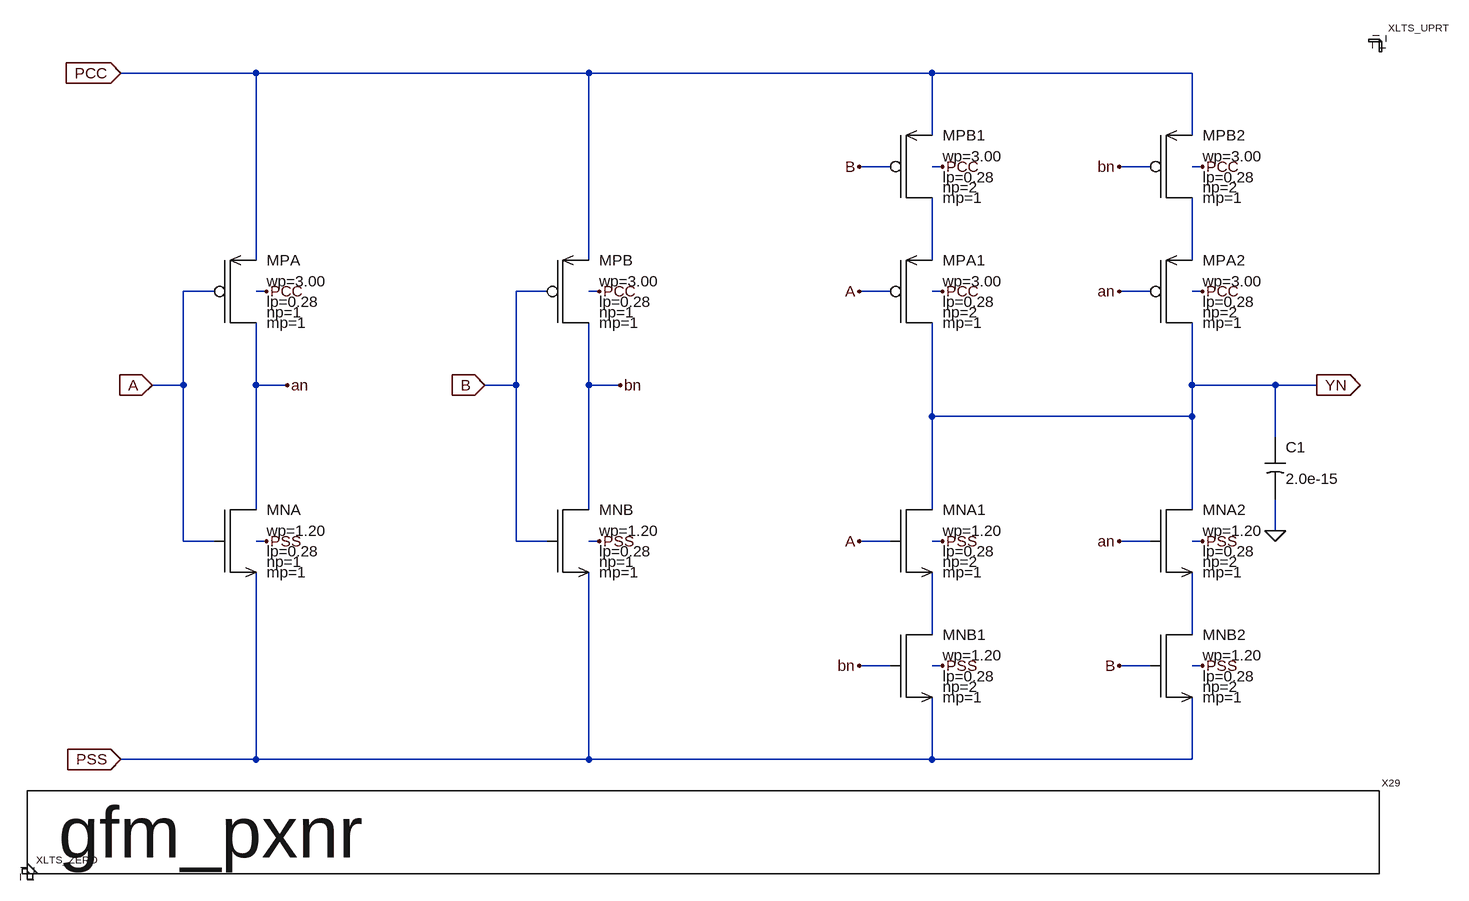
[diagram p0: schematic gfm_pxnr.asc]
gfm_pxnr.asc, the LTspice schematic file:
Version 4
SHEET 1 4552 4336
WIRE 352 -1232 144 -1232
WIRE 864 -1232 352 -1232
WIRE 1392 -1232 864 -1232
WIRE 1792 -1232 1392 -1232
WIRE 1392 -1136 1392 -1232
WIRE 1792 -1136 1792 -1232
WIRE 1328 -1088 1280 -1088
WIRE 1408 -1088 1392 -1088
WIRE 1728 -1088 1680 -1088
WIRE 1808 -1088 1792 -1088
WIRE 352 -944 352 -1232
WIRE 864 -944 864 -1232
WIRE 1392 -944 1392 -1040
WIRE 1792 -944 1792 -1040
WIRE 288 -896 240 -896
WIRE 368 -896 352 -896
WIRE 800 -896 752 -896
WIRE 880 -896 864 -896
WIRE 1328 -896 1280 -896
WIRE 1408 -896 1392 -896
WIRE 1728 -896 1680 -896
WIRE 1808 -896 1792 -896
WIRE 240 -752 240 -896
WIRE 240 -752 192 -752
WIRE 352 -752 352 -848
WIRE 400 -752 352 -752
WIRE 752 -752 752 -896
WIRE 752 -752 704 -752
WIRE 864 -752 864 -848
WIRE 912 -752 864 -752
WIRE 1792 -752 1792 -848
WIRE 1920 -752 1792 -752
WIRE 1984 -752 1920 -752
WIRE 1392 -704 1392 -848
WIRE 1792 -704 1792 -752
WIRE 1792 -704 1392 -704
WIRE 1920 -672 1920 -752
WIRE 352 -560 352 -752
WIRE 864 -560 864 -752
WIRE 1392 -560 1392 -704
WIRE 1792 -560 1792 -704
WIRE 1920 -528 1920 -576
WIRE 240 -512 240 -752
WIRE 288 -512 240 -512
WIRE 368 -512 352 -512
WIRE 752 -512 752 -752
WIRE 800 -512 752 -512
WIRE 880 -512 864 -512
WIRE 1328 -512 1280 -512
WIRE 1408 -512 1392 -512
WIRE 1728 -512 1680 -512
WIRE 1808 -512 1792 -512
WIRE 1392 -368 1392 -464
WIRE 1792 -368 1792 -464
WIRE 1328 -320 1280 -320
WIRE 1408 -320 1392 -320
WIRE 1728 -320 1680 -320
WIRE 1808 -320 1792 -320
WIRE 352 -176 352 -464
WIRE 352 -176 144 -176
WIRE 864 -176 864 -464
WIRE 864 -176 352 -176
WIRE 1392 -176 1392 -272
WIRE 1392 -176 864 -176
WIRE 1792 -176 1792 -272
WIRE 1792 -176 1392 -176
FLAG 144 -176 PSS
IOPIN 144 -176 In
FLAG 144 -1232 PCC
IOPIN 144 -1232 In
FLAG 192 -752 A
IOPIN 192 -752 In
FLAG 1984 -752 YN
IOPIN 1984 -752 Out
FLAG 1920 -528 0
FLAG 1808 -512 PSS
FLAG 1280 -512 A
FLAG 1408 -512 PSS
FLAG 1680 -512 an
FLAG 1808 -896 PCC
FLAG 1280 -896 A
FLAG 1408 -896 PCC
FLAG 1680 -896 an
FLAG 1808 -1088 PCC
FLAG 1408 -1088 PCC
FLAG 1808 -320 PSS
FLAG 1408 -320 PSS
FLAG 368 -512 PSS
FLAG 368 -896 PCC
FLAG 880 -512 PSS
FLAG 880 -896 PCC
FLAG 400 -752 an
FLAG 704 -752 B
IOPIN 704 -752 In
FLAG 912 -752 bn
FLAG 1280 -1088 B
FLAG 1280 -320 bn
FLAG 1680 -320 B
FLAG 1680 -1088 bn
SYMBOL gfmcu_nmos3p3 1328 -512 R0
SYMATTR InstName MNA1
SYMATTR SpiceLine np=2
SYMATTR Value wp=1.20
SYMATTR Value2 lp=0.28
SYMBOL gfmcu_nmos3p3 1328 -320 R0
SYMATTR InstName MNB1
SYMATTR SpiceLine np=2
SYMATTR Value wp=1.20
SYMATTR Value2 lp=0.28
SYMBOL gcap 1920 -672 R0
SYMATTR InstName C1
SYMATTR Value 2.0e-15
SYMBOL gfmcu_pmos3p3 1728 -896 R0
SYMATTR InstName MPA2
SYMATTR SpiceLine np=2
SYMATTR Value wp=3.00
SYMATTR Value2 lp=0.28
SYMBOL gfmcu_pmos3p3 1728 -1088 R0
SYMATTR InstName MPB2
SYMATTR SpiceLine np=2
SYMATTR Value wp=3.00
SYMATTR Value2 lp=0.28
SYMBOL gfmcu_pmos3p3 1328 -896 R0
SYMATTR InstName MPA1
SYMATTR SpiceLine np=2
SYMATTR Value wp=3.00
SYMATTR Value2 lp=0.28
SYMBOL gfmcu_pmos3p3 1328 -1088 R0
SYMATTR InstName MPB1
SYMATTR SpiceLine np=2
SYMATTR Value wp=3.00
SYMATTR Value2 lp=0.28
SYMBOL BD_GTitleLTS 0 0 R0
SYMATTR InstName X29
SYMATTR SpiceModel gfm_pxnr
SYMBOL gfmcu_nmos3p3 1728 -512 R0
SYMATTR InstName MNA2
SYMATTR SpiceLine np=2
SYMATTR Value wp=1.20
SYMATTR Value2 lp=0.28
SYMBOL gfmcu_nmos3p3 1728 -320 R0
SYMATTR InstName MNB2
SYMATTR SpiceLine np=2
SYMATTR Value wp=1.20
SYMATTR Value2 lp=0.28
SYMBOL gfmcu_nmos3p3 288 -512 R0
SYMATTR InstName MNA
SYMATTR Value wp=1.20
SYMATTR Value2 lp=0.28
SYMBOL gfmcu_pmos3p3 288 -896 R0
SYMATTR InstName MPA
SYMATTR Value wp=3.00
SYMATTR Value2 lp=0.28
SYMBOL gfmcu_nmos3p3 800 -512 R0
SYMATTR InstName MNB
SYMATTR Value wp=1.20
SYMATTR Value2 lp=0.28
SYMBOL gfmcu_pmos3p3 800 -896 R0
SYMATTR InstName MPB
SYMATTR Value wp=3.00
SYMATTR Value2 lp=0.28
SYMBOL BD_ZERO 0 0 R0
SYMATTR InstName XLTS_ZERO
SYMBOL BD_UPRT 2080 -1280 R0
SYMATTR InstName XLTS_UPRT

The netlist it stands for:
* gfm_pxnr.asc
XMNA1 YN A N003 PSS gfmcu_nmos3p3 wp=1.20 lp=0.28 np=2 mp=1  ; pins ND NG NS NB
XMNB1 N003 bn PSS PSS gfmcu_nmos3p3 wp=1.20 lp=0.28 np=2 mp=1  ; pins ND NG NS NB
C1 YN 0 2.0e-15
XMPA2 YN an N002 PCC gfmcu_pmos3p3 wp=3.00 lp=0.28 np=2 mp=1  ; pins ND NG NS NB
XMPB2 N002 bn PCC PCC gfmcu_pmos3p3 wp=3.00 lp=0.28 np=2 mp=1  ; pins ND NG NS NB
XMPA1 YN A N001 PCC gfmcu_pmos3p3 wp=3.00 lp=0.28 np=2 mp=1  ; pins ND NG NS NB
XMPB1 N001 B PCC PCC gfmcu_pmos3p3 wp=3.00 lp=0.28 np=2 mp=1  ; pins ND NG NS NB
XX29 BD_GTitleLTS
XMNA2 YN an N004 PSS gfmcu_nmos3p3 wp=1.20 lp=0.28 np=2 mp=1  ; pins ND NG NS NB
XMNB2 N004 B PSS PSS gfmcu_nmos3p3 wp=1.20 lp=0.28 np=2 mp=1  ; pins ND NG NS NB
XMNA an A PSS PSS gfmcu_nmos3p3 wp=1.20 lp=0.28 np=1 mp=1  ; pins ND NG NS NB
XMPA an A PCC PCC gfmcu_pmos3p3 wp=3.00 lp=0.28 np=1 mp=1  ; pins ND NG NS NB
XMNB bn B PSS PSS gfmcu_nmos3p3 wp=1.20 lp=0.28 np=1 mp=1  ; pins ND NG NS NB
XMPB bn B PCC PCC gfmcu_pmos3p3 wp=3.00 lp=0.28 np=1 mp=1  ; pins ND NG NS NB
XXLTS_ZERO BD_ZERO
XXLTS_UPRT BD_UPRT
.lib models_gfmcu.lib
.lib dmodels_analog.lib
.backanno
.end